# Altium schematic sheet CAN.SchDoc
size A; SheetNumber: 6; SheetTotal: 9
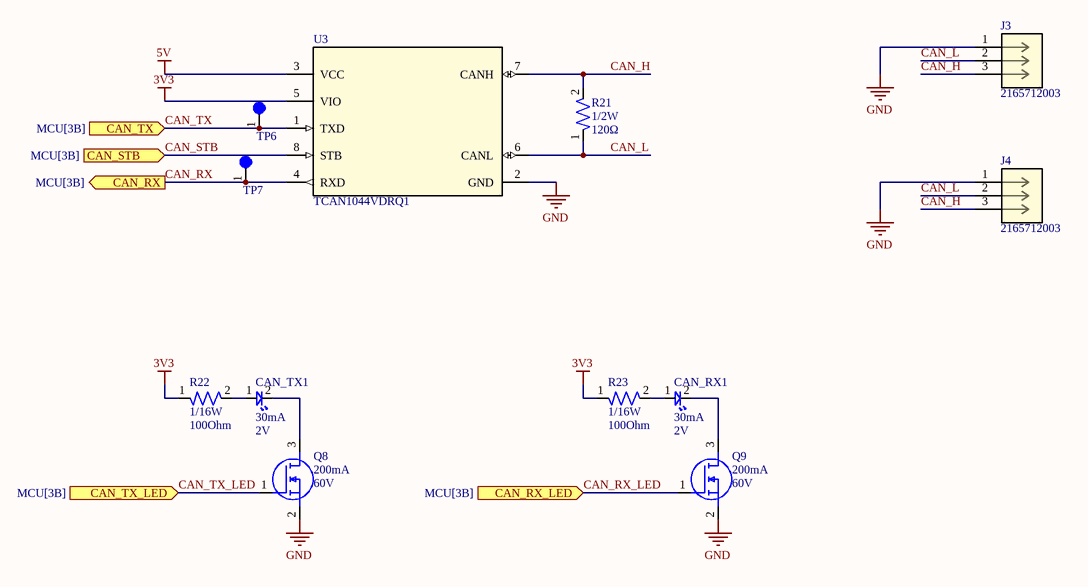
[diagram p0: CAN.SchDoc]

## Parts
CAN_RX1  Forward Current: 30mA  Forward Voltage: 2V  [LED-0603]  (hidden comment: BL-HKC36G-AV-TRB)
CAN_TX1  Forward Current: 30mA  Forward Voltage: 2V  [LED-0603]  (hidden comment: BL-HKC36G-AV-TRB)
J3  2165712003  [CONN_2165710003-SD_03_MOL]
J4  2165712003  [CONN_2165710003-SD_03_MOL]
Q8  Continuous Current: 200mA  Voltage: 60V  [IC-SOT23-3]  (hidden comment: T2N7002AK,LM)
Q9  Continuous Current: 200mA  Voltage: 60V  [IC-SOT23-3]  (hidden comment: T2N7002AK,LM)
R21  Wattage: 1/2W  Resistance: 120Ω  [RES-0603]  (hidden comment: RES 0603)
R22  Wattage: 1/16W  Resistance: 100Ohm  [RES-0402]  (hidden comment: RES 0402)
R23  Wattage: 1/16W  Resistance: 100Ohm  [RES-0402]  (hidden comment: RES 0603)
TP6  5003  [TEST-POINT-0001]  (value not drawn)
TP7  5003  [TEST-POINT-0001]  (value not drawn)
U3  TCAN1044VDRQ1  [IC-8SOIC]

## Ports
CAN_RX (out, see MCU[3B]), CAN_RX_LED (in, see MCU[3B]), CAN_STB (in, see MCU[3B]), CAN_TX (in, see MCU[3B]), CAN_TX_LED (in, see MCU[3B])

## Nets
3V3: R22.1 R23.1 U3.5(VIO)
5V: U3.3(VCC)
GND: J3.1 J4.1 Q8.2(S) Q9.2(S) U3.2(GND)
CAN_H: J3.3 J4.3 R21.2 U3.7(CANH)
CAN_L: J3.2 J4.2 R21.1 U3.6(CANL)
CAN_RX: TP7.1 U3.4(RXD) ; port CAN_RX
CAN_RX_LED: Q9.1(G) ; port CAN_RX_LED
CAN_STB: U3.8(STB) ; port CAN_STB
CAN_TX: TP6.1 U3.1(TXD) ; port CAN_TX
CAN_TX_LED: Q8.1(G) ; port CAN_TX_LED
NetCAN_RX1_1: CAN_RX1.1 R23.2
NetCAN_RX1_2: CAN_RX1.2 Q9.3(D)
NetCAN_TX1_1: CAN_TX1.1 R22.2
NetCAN_TX1_2: CAN_TX1.2 Q8.3(D)

## Library data of the parts
CAN_RX1 CAN_TX1 = LED-0001: LED YELLOW CLEAR 0603 SMD; ComponentLink1Description: Datasheet; ComponentLink1URL: https://www.americanbrightled.com/pdffiles/led-components/smt/BL-HKC36G-AV-TRB.pdf
J3 J4 = CONN MF+ 3 PIN VERT: Micro-Fit+ Vertical Header, Through Hole, 3.00mm Pitch, Single Row, 3 Circuits, 0.38Âµm Gold (Au) Plating, Glow-Wire Capable, Black; Manufacturer_Name: Molex Connector Corporation; Copyright: Copyright (C) 2026 Ultra Librarian. All rights reserved.; Manufacturer_Part_Number: 2165712003; RefDes: RefDes; Type: Type
Q8 Q9 = NMOS-200MA-0001: MOSFET N-CH 60V 200MA SOT23; ComponentLink1Description: Datasheet; ComponentLink1URL: https://toshiba.semicon-storage.com/info/T2N7002AK_datasheet_en_20150401.pdf?did=29712&prodName=T2N7002AK
R23 = RES 0402
TP6 TP7 = TEST-POINT-0001: Oranange PC Test Point, Miniature Phoisphor Bronze Silver Plating Through Hole Mounting Type
U3 = IC-CAN-0001: IC TRANSCEIVER 1/1 8SOIC; ComponentLink1Description: Datasheet; ComponentLink1URL: https://www.ti.com/lit/ds/symlink/tcan1044-q1.pdf?HQS=dis-dk-null-digikeymode-dsf-pf-null-wwe&ts=1728758303289&ref_url=https%253A%252F%252Fwww.ti.com%252Fgeneral%252Fdocs%252Fsuppproductinfo.tsp%253FdistId%253D10%2526gotoUrl%253Dhttps%253A%252F%252Fwww.ti.com%252Flit%252Fgpn%252Ftcan1044-q1